# Altium schematic sheet POWER.SchDoc (part 1 of 3)
size A2; SheetNumber: 3; SheetTotal: 3
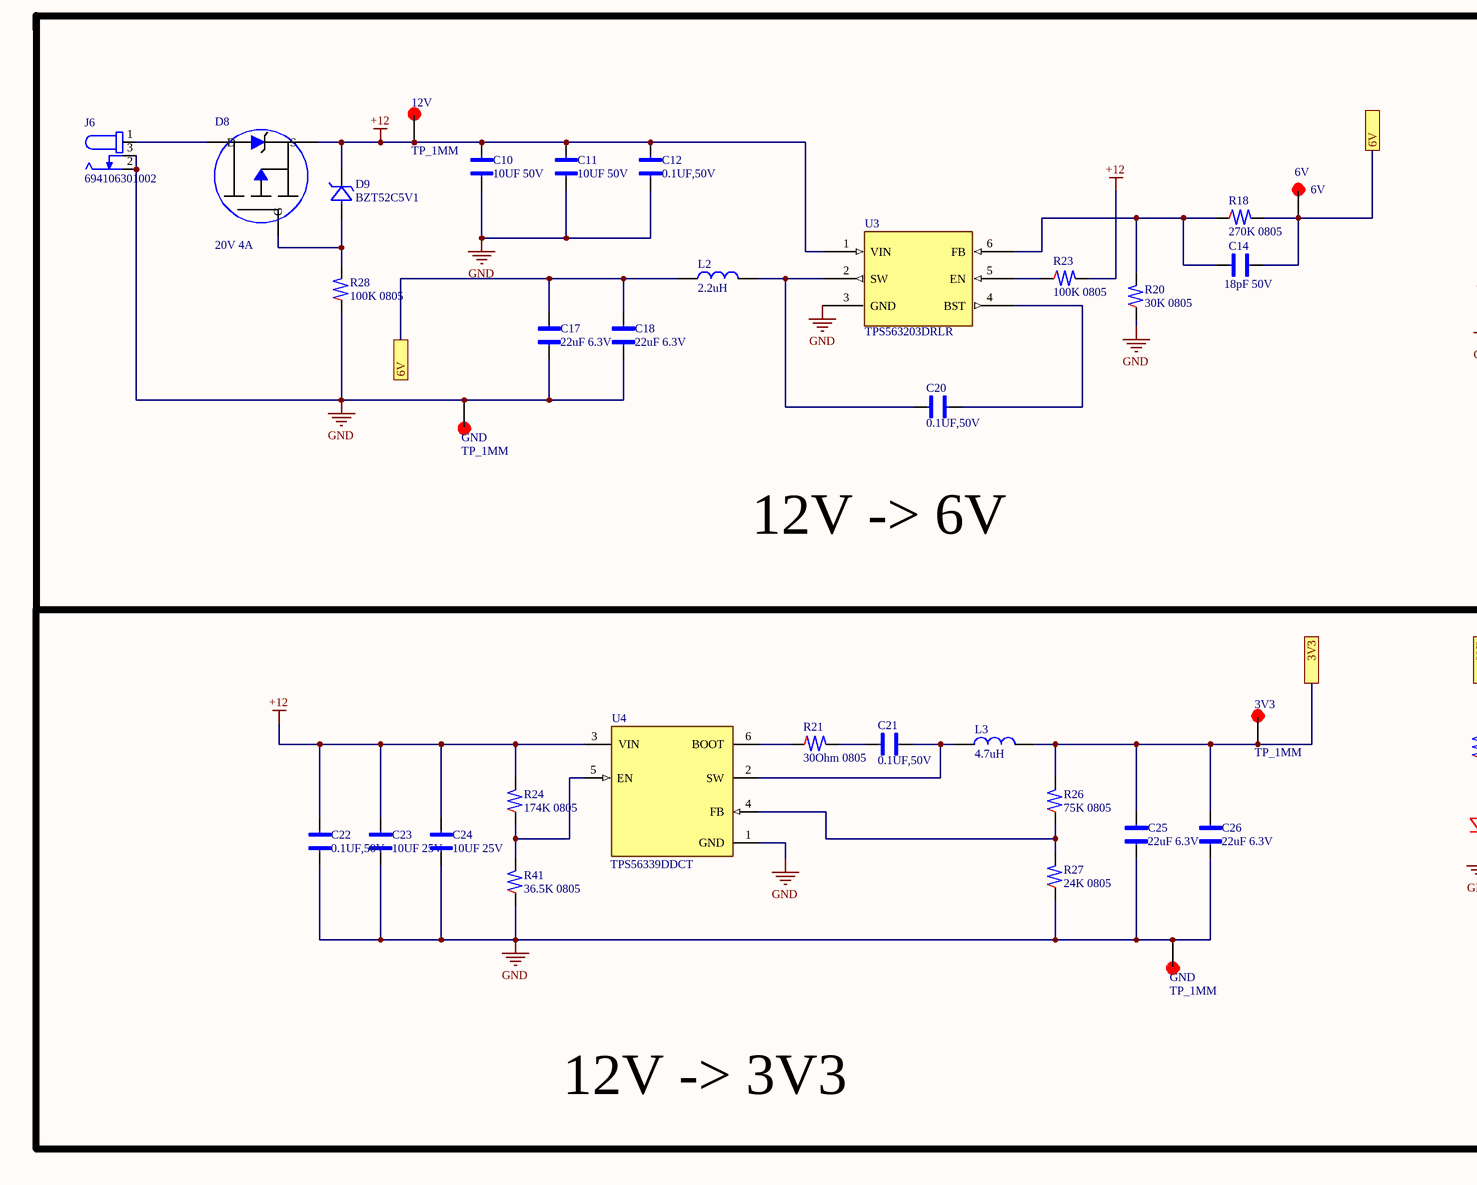
[diagram p0: POWER.SchDoc, left]
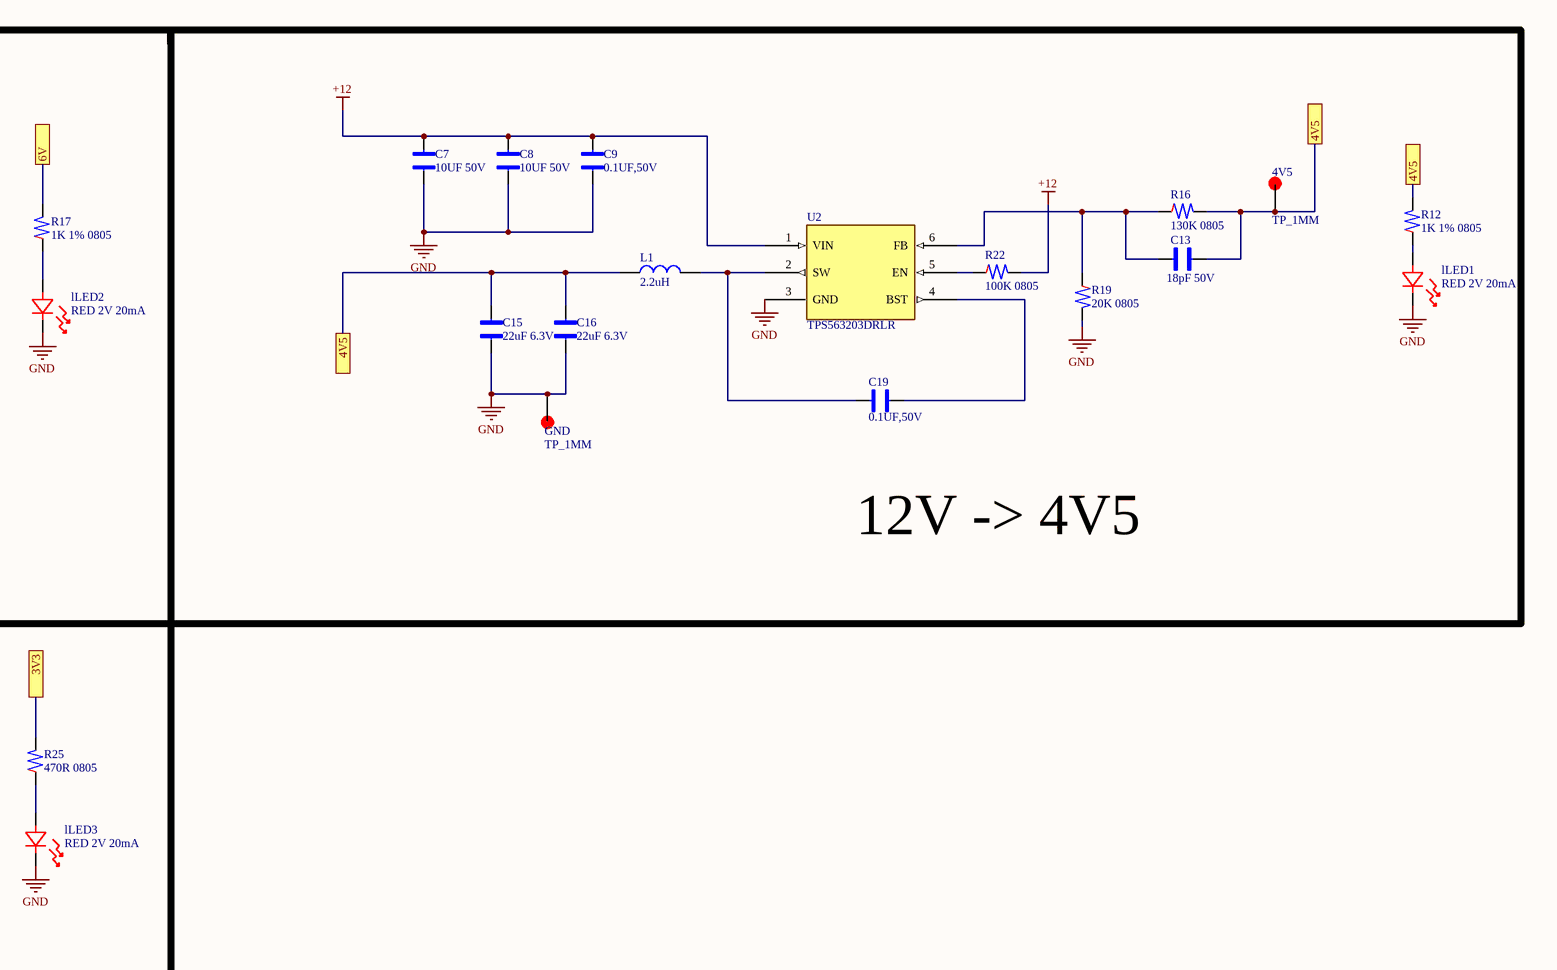
[diagram p1: POWER.SchDoc, right]

## Parts
(Parts that share a designator on the sheet are numbered #1, #2 ... from top to bottom, then left to right.)
3V3  TP_1MM  [TP_1mm]
4V5  TP_1MM  [TP_1mm]
6V  6V  [TP_1mm]
12V  TP_1MM  [TP_1mm]
C7  10UF 50V  [CAP_CER_0805]
C8  10UF 50V  [CAP_CER_0805]
C9  0.1UF,50V  [CAP_CER_0805]
C10  10UF 50V  [CAP_CER_0805]
C11  10UF 50V  [CAP_CER_0805]
C12  0.1UF,50V  [CAP_CER_0805]
C13  18pF 50V  [CAP_CER_0805]
C14  18pF 50V  [CAP_CER_0805]
C15  22uF 6.3V  [CAP_CER_0603]
C16  22uF 6.3V  [CAP_CER_0603]
C17  22uF 6.3V  [CAP_CER_0603]
C18  22uF 6.3V  [CAP_CER_0603]
C19  0.1UF,50V  [CAP_CER_0805]
C20  0.1UF,50V  [CAP_CER_0805]
C21  0.1UF,50V  [CAP_CER_0805]
C22  0.1UF,50V  [CAP_CER_0805]
C23  10UF 25V  [CAP_CER_0805]
C24  10UF 25V  [CAP_CER_0805]
C25  22uF 6.3V  [CAP_CER_0603]
C26  22uF 6.3V  [CAP_CER_0603]
D8  20V 4A  [SOT-23-3]
D9  BZT52C5V1  [SOD-123]
GND#1  TP_1MM  [TP_1mm]
GND#2  TP_1MM  [TP_1mm]
GND#3  TP_1MM  [TP_1mm]
J6  694106301002  [CONN PWR JACK 2.1X5.5MM SOLDER]
L1  2.2uH  [IND_12.5x12.5_H8.5]
L2  2.2uH  [IND_12.5x12.5_H8.5]
L3  4.7uH  [IND_6.8X6.5_H2.8]
lLED1  RED 2V 20mA  [LED_LS R976_AOS]
lLED2  RED 2V 20mA  [LED_LS R976_AOS]
lLED3  RED 2V 20mA  [LED_LS R976_AOS]
R12  1K 1% 0805  [RES_0805]
R16  130K 0805  [RES_0805]
R17  1K 1% 0805  [RES_0805]
R18  270K 0805  [RES_0805]
R19  20K 0805  [RES_0805]
R20  30K 0805  [RES_0805]
R21  30Ohm 0805  [RES_0805]
R22  100K 0805  [RES_0805]
R23  100K 0805  [RES_0805]
R24  174K 0805  [RES_0805]
R25  470R 0805  [RES_0805]
R26  75K 0805  [RES_0805]
R27  24K 0805  [RES_0805]
R28  100K 0805  [RES_0805]
R41  36.5K 0805  [RES_0805]
U2  TPS563203DRLR  [SOT-563]
U3  TPS563203DRLR  [SOT-563]
U4  TPS56339DDCT  [SOT-23-6]

## Blocks framed on the sheet
12V -> 3V3: 3V3 C21-C26 GND#3 L3 lLED3 R21 R24-R27 R41 U4

## Ports
3V3, 4V5, 6V

## Nets
+12: 12V.1 C7.2 C8.2 C9.2 C10.2 C11.2 C12.2 C22.2 C23.2 C24.2 D8.2(S) D9.1(CATHODE) R22.2 R23.2 R24.2 U2.1(VIN) U3.1(VIN) U4.3(VIN)
GND: C7.1 C8.1 C9.1 C10.1 C11.1 C12.1 C15.1 C16.1 C17.1 C18.1 C22.1 C23.1 C24.1 C25.1 C26.1 GND#1.1 GND#2.1 GND#3.1 J6.2 J6.3 lLED1.1 lLED2.1 lLED3.1 R19.2 R20.1 R27.1 R28.1 R41.1 U2.3(GND) U3.3(GND) U4.1(GND)
3V3: 3V3.1 C25.2 C26.2 L3.2 R25.2 R26.2 ; port 3V3
4V5: 4V5.1 C13.2 C15.2 C16.2 L1.1 R12.2 R16.2 ; port 4V5
6V: 6V.1 C14.2 C17.2 C18.2 L2.1 R17.2 R18.2 ; port 6V
NetC13_1: C13.1 R16.1 R19.1 U2.6(FB)
NetC14_1: C14.1 R18.1 R20.2 U3.6(FB)
NetC19_1: C19.1 L1.2 U2.2(SW)
NetC19_2: C19.2 U2.4(BST)
NetC20_1: C20.1 L2.2 U3.2(SW)
NetC20_2: C20.2 U3.4(BST)
NetC21_1: C21.1 L3.1 U4.2(SW)
NetC21_2: C21.2 R21.2
NetD8_1: D8.1(G) D9.2(ANODE) R28.2
NetD8_3: D8.3(D) J6.1
NetlLED1_2: lLED1.2 R12.1
NetlLED2_2: lLED2.2 R17.1
NetlLED3_2: lLED3.2 R25.1
NetR21_1: R21.1 U4.6(BOOT)
NetR22_1: R22.1 U2.5(EN)
NetR23_1: R23.1 U3.5(EN)
NetR24_1: R24.1 R41.2 U4.5(EN)
NetR26_1: R26.1 R27.2 U4.4(FB)

## Notes on the sheet
- 12V -> 6V
- 12V -> 4V5